# Altium schematic sheet push-button-switch-13.SchDoc
size A4; SheetNumber: 13; SheetTotal: 17
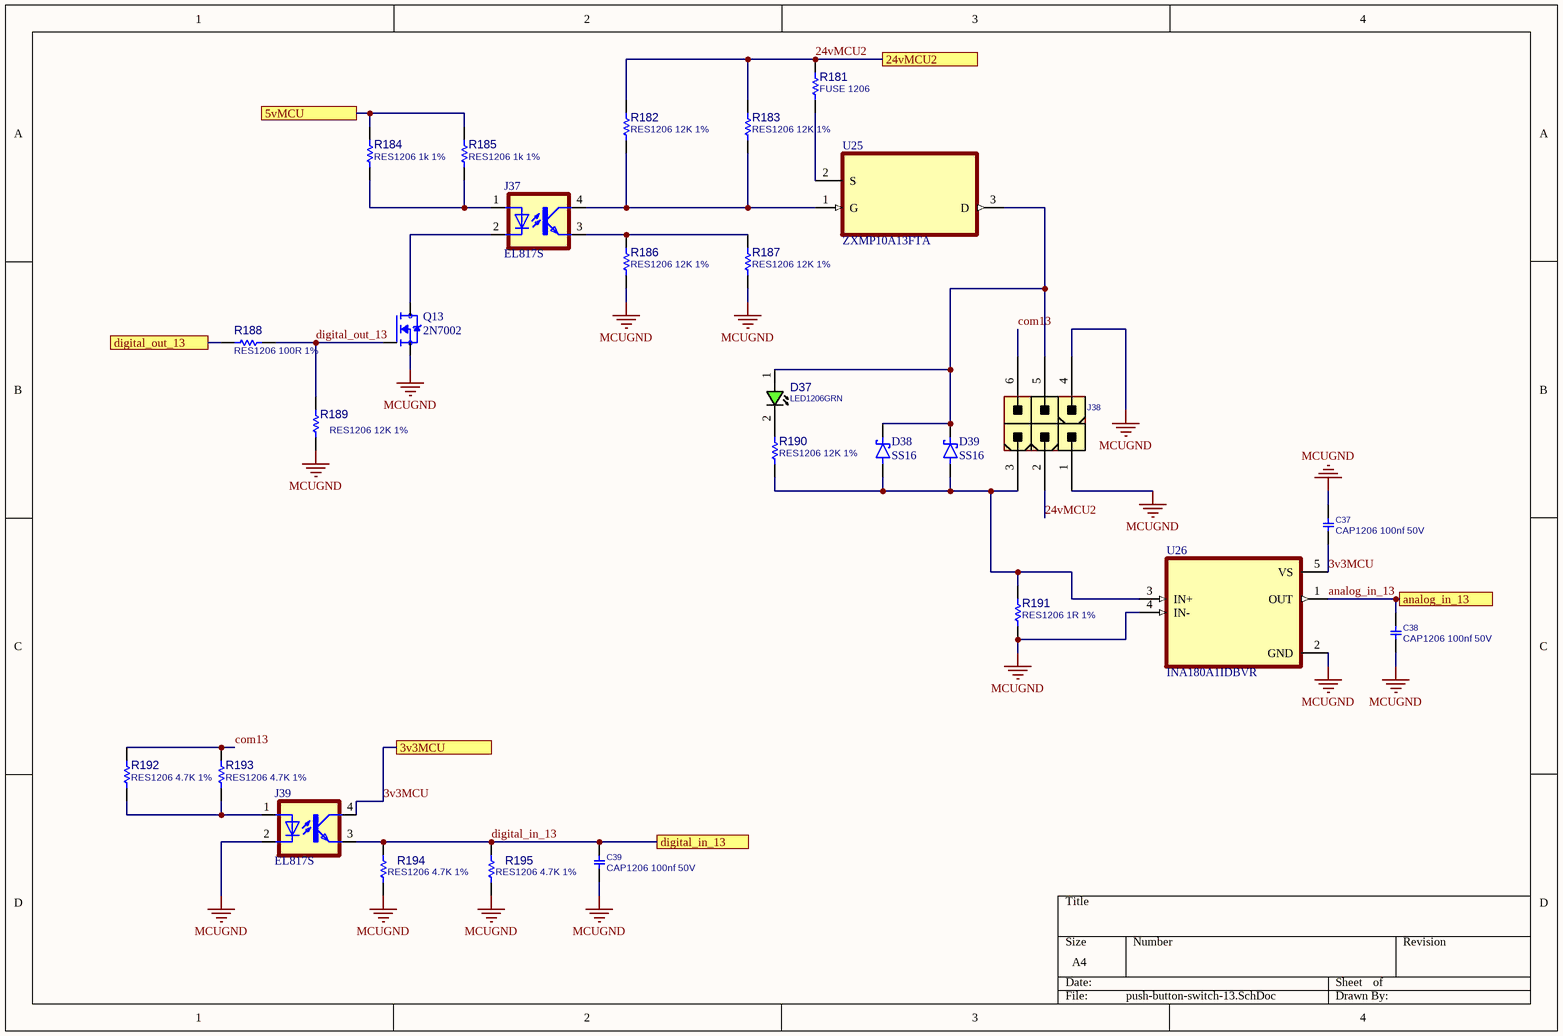
[diagram p0: push-button-switch-13.SchDoc]

## Parts
C37  CAP1206 100nf 50V  [C1206]
C38  CAP1206 100nf 50V  [C1206]
C39  CAP1206 100nf 50V  [C1206]
D37  LED1206GRN  [LED1206GRN]
D38  SS16  [DIOM4325X250N]
D39  SS16  [DIOM4325X250N]
J37  EL817S  [SOIC254P1030X460-4N]
J38  CONN_ATXPWR_6  [ATXPWR_6]  (value not drawn)
J39  EL817S  [SOIC254P1030X460-4N]
Q13  2N7002  [SOT95P240X111-3N]
R181  FUSE 1206  [R1206]
R182  RES1206 12K 1%  [R1206]
R183  RES1206 12K 1%  [R1206]
R184  RES1206 1k 1%  [R1206]
R185  RES1206 1k 1%  [R1206]
R186  RES1206 12K 1%  [R1206]
R187  RES1206 12K 1%  [R1206]
R188  RES1206 100R 1%  [R1206]
R189  RES1206 12K 1%  [R1206]
R190  RES1206 12K 1%  [R1206]
R191  RES1206 1R 1%  [R1206]
R192  RES1206 4.7K 1%  [R1206]
R193  RES1206 4.7K 1%  [R1206]
R194  RES1206 4.7K 1%  [R1206]
R195  RES1206 4.7K 1%  [R1206]
U25  ZXMP10A13FTA  [SOT95P230X110-3N]
U26  INA180A1IDBVR  [SOT95P280X145-5N]

## Ports
3v3MCU, 5vMCU, 24vMCU2, analog_in_13, digital_in_13, digital_out_13

## Nets
MCUGND: C37.1 C38.2 C39.2 J38.1 J38.4 J39.2(C) Q13.2(S) R186.2 R187.2 R189.2 R191.2 R194.1 R195.1 U26.2(GND) U26.4(IN-)
3v3MCU: C37.2 J39.4(COL) U26.5(VS) ; port 3v3MCU
5vMCU: R184.2 R185.2 ; port 5vMCU
24vMCU2: J38.2 R181.1 R182.1 R183.1 ; port 24vMCU2
analog_in_13: C38.1 U26.1(OUT) ; port analog_in_13
com13: J38.6 R192.2 R193.2
digital_in_13: C39.1 J39.3(EMIT) R194.2 R195.2 ; port digital_in_13
digital_out_13: Q13.1(G) R188.2 R189.1
digital_out_13: R188.1 ; port digital_out_13  [a separate net that carries the same name]
NetD37_1: D37.1(ANODE) D38.C(K) D39.C(K) J38.5 U25.3(D)
NetD37_2: D37.2(CATHODE) R190.1
NetD38_A: D38.A D39.A J38.3 R190.2 R191.1 U26.3(IN+)
NetJ37_1: J37.1(A) R184.1 R185.1
NetJ37_2: J37.2(C) Q13.3(D)
NetJ37_3: J37.3(EMIT) R186.1 R187.1
NetJ37_4: J37.4(COL) R182.2 R183.2 U25.1(G)
NetJ39_1: J39.1(A) R192.1 R193.1
NetR181_2: R181.2 U25.2(S)

## Library data of the parts
C37-C39 = CAP_SMD_MLCC_1206: CAP, MLCC; PARAM: -, -%; MANF_P#: MANF_PART#; PARAM2: -V; PRICE: 100= 1$; MANF: -; ASSEMBLY: ASSEMBLY
D37 = LED_SMD_1206_GRN: LED, SMD, 1206, GREEN; PARAM: 20mA; DESC: DESCRIPTION; PARAM2: 2.2V; MANF: -; ASSEMBLY: ASSEMBLY; PRICE: 36t@Javan; MANF_P#: -; VALUE: LED1206GRN; MountType: SMT; PartType: LED
D38 D39 = SS14: 1A, 40V, Schottky Rectifier; MF: Taiwan Semiconductor; SnapEDA_Link: https://www.snapeda.com/parts/SS14/taiwan/view-part/?ref=snap; Package: SMA-2 Taiwan Semiconductor; Value: *; MP: SS14; Check_prices: https://www.snapeda.com/parts/SS14/taiwan/view-part/?ref=eda
J37 J39 = EL817S: Optoisolator Transistor Output 5000Vrms 1 Channel 4-SMD; MF: Everlight Electronics; SnapEDA_Link: https://www.snapeda.com/parts/EL817S/Everlight+Electronics+Co+Ltd/view-part/?ref=snap; Package: SMD-4 Everlight Electronics Co Ltd; Value: *; MP: EL817S; Check_prices: https://www.snapeda.com/parts/EL817S/Everlight+Electronics+Co+Ltd/view-part/?ref=eda
J38 = CONN_ATXPWR_6: CONN, ATX POWER, 6 P; MANF: TE; MANF_P#: 4-1775099-1; VALUE: CONN_ATXPWR_6; MountType: THD; PACKAGE: ATXPWR-6pin; Part Type: Conn.
Q13 = 2N7002: N-Channel 60V 280mA (Ta) 350mW (Ta) Surface Mount SOT-23-3 (TO-236); MF: {'manufacturer': u'onsemi'}; Package: None; Price: None; Value: *; MP: 2N7002; Availability: Unavailable
R181-R195 = RES_SMD_1206: RESISTOR, SMD; PARAM: 1%, 0.25W; DESC: DESCRIPTION; DIST#: MOUSER; MANF_P#: -; MANF: -; ASSEMBLY: ASSEMBLY; PRICE: -; PARAM2: -
U25 = ZXMP10A13FTA: P-Channel 100 V 600mA (Ta) 625mW (Ta) Surface Mount SOT-23-3; MF: Diodes Inc.; Purchase-URL: https://pricing.snapeda.com/search/part/ZXMP10A13FTA/?ref=eda; Package: SOT-23-3 Diodes Inc.; SnapEDA_Link: https://www.snapeda.com/parts/ZXMP10A13FTA/Diodes+Inc./view-part/?ref=snap; Availability: In Stock; Value: *; MP: ZXMP10A13FTA; Check_prices: https://www.snapeda.com/parts/ZXMP10A13FTA/Diodes+Inc./view-part/?ref=eda; Price: None
U26 = INA180A1IDBVR: 26V, 350kHz current sense amplifier; MF: Texas Instruments; SnapEDA_Link: https://www.snapeda.com/parts/INA180A1IDBVR/Texas+Instruments/view-part/?ref=snap; Package: SOT-23-5 Texas Instruments; Value: *; MP: INA180A1IDBVR; Check_prices: https://www.snapeda.com/parts/INA180A1IDBVR/Texas+Instruments/view-part/?ref=eda